# Altium schematic sheet Top Sheet.SchDoc
size A4; Organization: Altium Limited; Address1: L3, 12a Rodborough Rd; Address2: Frenchs Forest; Address3: NSW; Address4: Australia 2086; DocumentNumber: 0; SheetNumber: 0; SheetTotal: 4
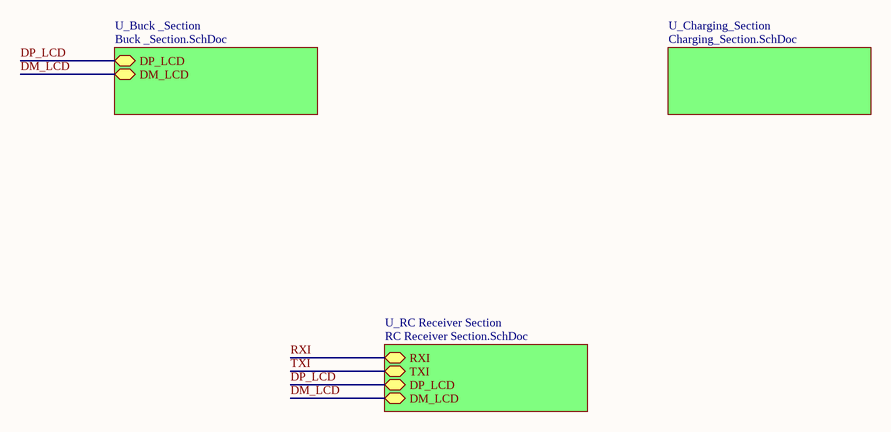
[diagram p0: Top Sheet.SchDoc]

## Sub-sheets
U_Buck _Section = Buck _Section.SchDoc: DP_LCD (bidir), DM_LCD (bidir)
U_Charging_Section = Charging_Section.SchDoc: no entries
U_RC Receiver Section = RC Receiver Section.SchDoc: RXI (bidir), TXI (bidir), DP_LCD (bidir), DM_LCD (bidir)

## Nets
DM_LCD: sheet U_Buck _Section/DM_LCD, sheet U_RC Receiver Section/DM_LCD
DP_LCD: sheet U_Buck _Section/DP_LCD, sheet U_RC Receiver Section/DP_LCD
RXI: sheet U_RC Receiver Section/RXI
TXI: sheet U_RC Receiver Section/TXI

## Notes on the sheet
- Title
- Size:
- Date:
- A4
- Number:
- Time:
- Revision:
- Sheet
- of
- File: